# Altium schematic sheet RK3588-DDR-Controller.SchDoc
size 420 x 297 mm; SheetNumber: 6; SheetTotal: 22
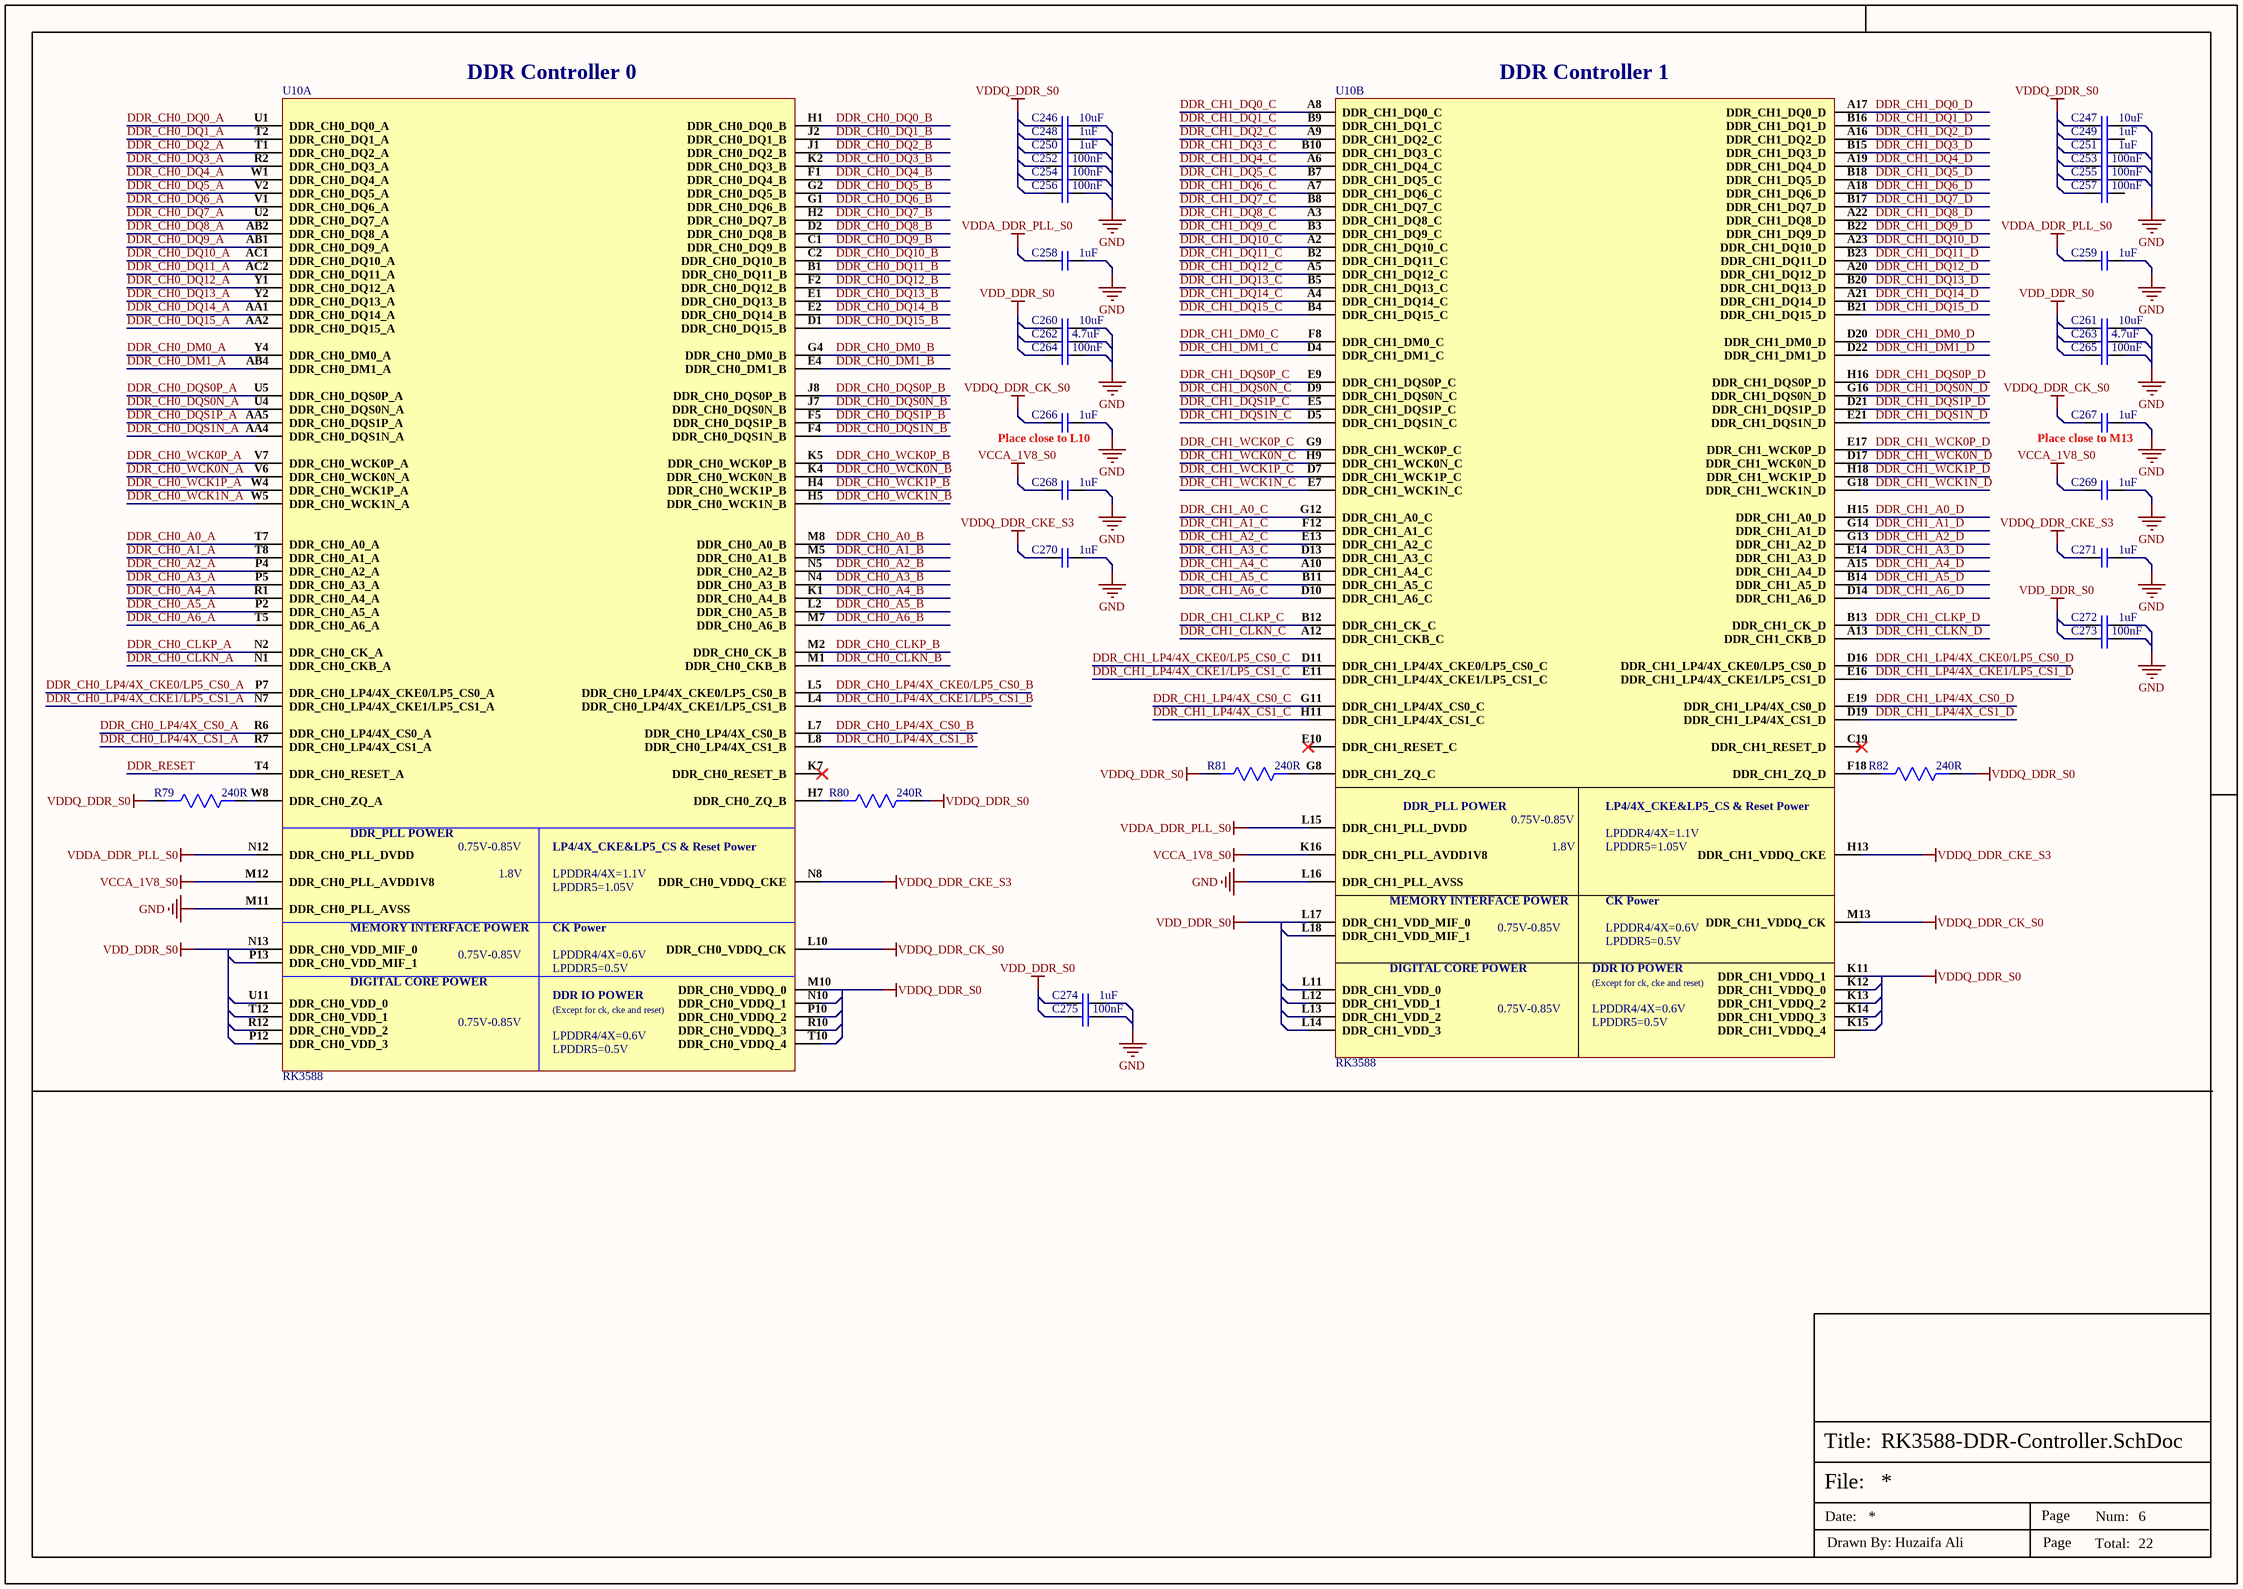
[diagram p0: RK3588-DDR-Controller.SchDoc]

## Parts
C246  10uF  [Cap-0402]
C247  10uF  [Cap-0402]
C248  1uF  [CAP-0201]
C249  1uF  [CAP-0201]
C250  1uF  [CAP-0201]
C251  1uF  [CAP-0201]
C252  100nF  [CAP-0201]
C253  100nF  [CAP-0201]
C254  100nF  [CAP-0201]
C255  100nF  [CAP-0201]
C256  100nF  [CAP-0201]
C257  100nF  [CAP-0201]
C258  1uF  [CAP-0201]
C259  1uF  [CAP-0201]
C260  10uF  [Cap-0402]
C261  10uF  [Cap-0402]
C262  4.7uF  [Cap-0402]
C263  4.7uF  [Cap-0402]
C264  100nF  [CAP-0201]
C265  100nF  [CAP-0201]
C266  1uF  [CAP-0201]
C267  1uF  [CAP-0201]
C268  1uF  [CAP-0201]
C269  1uF  [CAP-0201]
C270  1uF  [CAP-0201]
C271  1uF  [CAP-0201]
C272  1uF  [CAP-0201]
C273  100nF  [CAP-0201]
C274  1uF  [CAP-0201]
C275  100nF  [CAP-0201]
R79  240R  [Res-0402]
R80  240R  [Res-0402]
R81  240R  [Res-0402]
R82  240R  [Res-0402]
U10  RK3588  [FCBGA-1088L]  (parts A,B of 26)

## Nets
GND: C246.2 C247.2 C248.2 C250.2 C251.2 C252.2 C253.2 C254.2 C255.2 C256.2 C258.2 C259.2 C260.2 C261.2 C262.2 C263.2 C264.2 C265.2 C266.2 C267.2 C268.2 C269.2 C270.2 C271.2 C272.2 C273.2 C274.2 C275.2 U10.L16(DDR_CH1_PLL_AVSS) U10.M11(DDR_CH0_PLL_AVSS)
VCCA_1V8_S0: C268.1 C269.1 U10.K16(DDR_CH1_PLL_AVDD1V8) U10.M12(DDR_CH0_PLL_AVDD1V8)
VDD_DDR_S0: C260.1 C261.1 C262.1 C263.1 C264.1 C265.1 C272.1 C273.1 C274.1 C275.1 U10.L11(DDR_CH1_VDD_0) U10.L12(DDR_CH1_VDD_1) U10.L13(DDR_CH1_VDD_2) U10.L14(DDR_CH1_VDD_3) U10.L17(DDR_CH1_VDD_MIF_0) U10.L18(DDR_CH1_VDD_MIF_1) U10.N13(DDR_CH0_VDD_MIF_0) U10.P12(DDR_CH0_VDD_3) U10.P13(DDR_CH0_VDD_MIF_1) U10.R12(DDR_CH0_VDD_2) U10.T12(DDR_CH0_VDD_1) U10.U11(DDR_CH0_VDD_0)
VDDA_DDR_PLL_S0: C258.1 C259.1 U10.L15(DDR_CH1_PLL_DVDD) U10.N12(DDR_CH0_PLL_DVDD)
VDDQ_DDR_CK_S0: C266.1 C267.1 U10.L10(DDR_CH0_VDDQ_CK) U10.M13(DDR_CH1_VDDQ_CK)
VDDQ_DDR_CKE_S3: C270.1 C271.1 U10.H13(DDR_CH1_VDDQ_CKE) U10.N8(DDR_CH0_VDDQ_CKE)
VDDQ_DDR_S0: C246.1 C247.1 C248.1 C249.1 C250.1 C251.1 C252.1 C253.1 C254.1 C255.1 C256.1 C257.1 R79.2 R80.1 R81.2 R82.1 U10.K11(DDR_CH1_VDDQ_1) U10.K12(DDR_CH1_VDDQ_0) U10.K13(DDR_CH1_VDDQ_2) U10.K14(DDR_CH1_VDDQ_3) U10.K15(DDR_CH1_VDDQ_4) U10.M10(DDR_CH0_VDDQ_0) U10.N10(DDR_CH0_VDDQ_1) U10.P10(DDR_CH0_VDDQ_2) U10.R10(DDR_CH0_VDDQ_3) U10.T10(DDR_CH0_VDDQ_4)
DDR_CH0_A0_A: U10.T7(DDR_CH0_A0_A)
DDR_CH0_A0_B: U10.M8(DDR_CH0_A0_B)
DDR_CH0_A1_A: U10.T8(DDR_CH0_A1_A)
DDR_CH0_A1_B: U10.M5(DDR_CH0_A1_B)
DDR_CH0_A2_A: U10.P4(DDR_CH0_A2_A)
DDR_CH0_A2_B: U10.N5(DDR_CH0_A2_B)
DDR_CH0_A3_A: U10.P5(DDR_CH0_A3_A)
DDR_CH0_A3_B: U10.N4(DDR_CH0_A3_B)
DDR_CH0_A4_A: U10.R1(DDR_CH0_A4_A)
DDR_CH0_A4_B: U10.K1(DDR_CH0_A4_B)
DDR_CH0_A5_A: U10.P2(DDR_CH0_A5_A)
DDR_CH0_A5_B: U10.L2(DDR_CH0_A5_B)
DDR_CH0_A6_A: U10.T5(DDR_CH0_A6_A)
DDR_CH0_A6_B: U10.M7(DDR_CH0_A6_B)
DDR_CH0_CLKN_A: U10.N1(DDR_CH0_CKB_A)
DDR_CH0_CLKN_B: U10.M1(DDR_CH0_CKB_B)
DDR_CH0_CLKP_A: U10.N2(DDR_CH0_CK_A)
DDR_CH0_CLKP_B: U10.M2(DDR_CH0_CK_B)
DDR_CH0_DM0_A: U10.Y4(DDR_CH0_DM0_A)
DDR_CH0_DM0_B: U10.G4(DDR_CH0_DM0_B)
DDR_CH0_DM1_A: U10.AB4(DDR_CH0_DM1_A)
DDR_CH0_DM1_B: U10.E4(DDR_CH0_DM1_B)
DDR_CH0_DQ0_A: U10.U1(DDR_CH0_DQ0_A)
DDR_CH0_DQ0_B: U10.H1(DDR_CH0_DQ0_B)
DDR_CH0_DQ1_A: U10.T2(DDR_CH0_DQ1_A)
DDR_CH0_DQ1_B: U10.J2(DDR_CH0_DQ1_B)
DDR_CH0_DQ2_A: U10.T1(DDR_CH0_DQ2_A)
DDR_CH0_DQ2_B: U10.J1(DDR_CH0_DQ2_B)
DDR_CH0_DQ3_A: U10.R2(DDR_CH0_DQ3_A)
DDR_CH0_DQ3_B: U10.K2(DDR_CH0_DQ3_B)
DDR_CH0_DQ4_A: U10.W1(DDR_CH0_DQ4_A)
DDR_CH0_DQ4_B: U10.F1(DDR_CH0_DQ4_B)
DDR_CH0_DQ5_A: U10.V2(DDR_CH0_DQ5_A)
DDR_CH0_DQ5_B: U10.G2(DDR_CH0_DQ5_B)
DDR_CH0_DQ6_A: U10.V1(DDR_CH0_DQ6_A)
DDR_CH0_DQ6_B: U10.G1(DDR_CH0_DQ6_B)
DDR_CH0_DQ7_A: U10.U2(DDR_CH0_DQ7_A)
DDR_CH0_DQ7_B: U10.H2(DDR_CH0_DQ7_B)
DDR_CH0_DQ8_A: U10.AB2(DDR_CH0_DQ8_A)
DDR_CH0_DQ8_B: U10.D2(DDR_CH0_DQ8_B)
DDR_CH0_DQ9_A: U10.AB1(DDR_CH0_DQ9_A)
DDR_CH0_DQ9_B: U10.C1(DDR_CH0_DQ9_B)
DDR_CH0_DQ10_A: U10.AC1(DDR_CH0_DQ10_A)
DDR_CH0_DQ10_B: U10.C2(DDR_CH0_DQ10_B)
DDR_CH0_DQ11_A: U10.AC2(DDR_CH0_DQ11_A)
DDR_CH0_DQ11_B: U10.B1(DDR_CH0_DQ11_B)
DDR_CH0_DQ12_A: U10.Y1(DDR_CH0_DQ12_A)
DDR_CH0_DQ12_B: U10.F2(DDR_CH0_DQ12_B)
DDR_CH0_DQ13_A: U10.Y2(DDR_CH0_DQ13_A)
DDR_CH0_DQ13_B: U10.E1(DDR_CH0_DQ13_B)
DDR_CH0_DQ14_A: U10.AA1(DDR_CH0_DQ14_A)
DDR_CH0_DQ14_B: U10.E2(DDR_CH0_DQ14_B)
DDR_CH0_DQ15_A: U10.AA2(DDR_CH0_DQ15_A)
DDR_CH0_DQ15_B: U10.D1(DDR_CH0_DQ15_B)
DDR_CH0_DQS0N_A: U10.U4(DDR_CH0_DQS0N_A)
DDR_CH0_DQS0N_B: U10.J7(DDR_CH0_DQS0N_B)
DDR_CH0_DQS0P_A: U10.U5(DDR_CH0_DQS0P_A)
DDR_CH0_DQS0P_B: U10.J8(DDR_CH0_DQS0P_B)
DDR_CH0_DQS1N_A: U10.AA4(DDR_CH0_DQS1N_A)
DDR_CH0_DQS1N_B: U10.F4(DDR_CH0_DQS1N_B)
DDR_CH0_DQS1P_A: U10.AA5(DDR_CH0_DQS1P_A)
DDR_CH0_DQS1P_B: U10.F5(DDR_CH0_DQS1P_B)
DDR_CH0_LP4/4X_CKE0/LP5_CS0_A: U10.P7(DDR_CH0_LP4/4X_CKE0/LP5_CS0_A)
DDR_CH0_LP4/4X_CKE0/LP5_CS0_B: U10.L5(DDR_CH0_LP4/4X_CKE0/LP5_CS0_B)
DDR_CH0_LP4/4X_CKE1/LP5_CS1_A: U10.N7(DDR_CH0_LP4/4X_CKE1/LP5_CS1_A)
DDR_CH0_LP4/4X_CKE1/LP5_CS1_B: U10.L4(DDR_CH0_LP4/4X_CKE1/LP5_CS1_B)
DDR_CH0_LP4/4X_CS0_A: U10.R6(DDR_CH0_LP4/4X_CS0_A)
DDR_CH0_LP4/4X_CS0_B: U10.L7(DDR_CH0_LP4/4X_CS0_B)
DDR_CH0_LP4/4X_CS1_A: U10.R7(DDR_CH0_LP4/4X_CS1_A)
DDR_CH0_LP4/4X_CS1_B: U10.L8(DDR_CH0_LP4/4X_CS1_B)
DDR_CH0_WCK0N_A: U10.V6(DDR_CH0_WCK0N_A)
DDR_CH0_WCK0N_B: U10.K4(DDR_CH0_WCK0N_B)
DDR_CH0_WCK0P_A: U10.V7(DDR_CH0_WCK0P_A)
DDR_CH0_WCK0P_B: U10.K5(DDR_CH0_WCK0P_B)
DDR_CH0_WCK1N_A: U10.W5(DDR_CH0_WCK1N_A)
DDR_CH0_WCK1N_B: U10.H5(DDR_CH0_WCK1N_B)
DDR_CH0_WCK1P_A: U10.W4(DDR_CH0_WCK1P_A)
DDR_CH0_WCK1P_B: U10.H4(DDR_CH0_WCK1P_B)
DDR_CH1_A0_C: U10.G12(DDR_CH1_A0_C)
DDR_CH1_A0_D: U10.H15(DDR_CH1_A0_D)
DDR_CH1_A1_C: U10.F12(DDR_CH1_A1_C)
DDR_CH1_A1_D: U10.G14(DDR_CH1_A1_D)
DDR_CH1_A2_C: U10.E13(DDR_CH1_A2_C)
DDR_CH1_A2_D: U10.G13(DDR_CH1_A2_D)
DDR_CH1_A3_C: U10.D13(DDR_CH1_A3_C)
DDR_CH1_A3_D: U10.E14(DDR_CH1_A3_D)
DDR_CH1_A4_C: U10.A10(DDR_CH1_A4_C)
DDR_CH1_A4_D: U10.A15(DDR_CH1_A4_D)
DDR_CH1_A5_C: U10.B11(DDR_CH1_A5_C)
DDR_CH1_A5_D: U10.B14(DDR_CH1_A5_D)
DDR_CH1_A6_C: U10.D10(DDR_CH1_A6_C)
DDR_CH1_A6_D: U10.D14(DDR_CH1_A6_D)
DDR_CH1_CLKN_C: U10.A12(DDR_CH1_CKB_C)
DDR_CH1_CLKN_D: U10.A13(DDR_CH1_CKB_D)
DDR_CH1_CLKP_C: U10.B12(DDR_CH1_CK_C)
DDR_CH1_CLKP_D: U10.B13(DDR_CH1_CK_D)
DDR_CH1_DM0_C: U10.F8(DDR_CH1_DM0_C)
DDR_CH1_DM0_D: U10.D20(DDR_CH1_DM0_D)
DDR_CH1_DM1_C: U10.D4(DDR_CH1_DM1_C)
DDR_CH1_DM1_D: U10.D22(DDR_CH1_DM1_D)
DDR_CH1_DQ0_C: U10.A8(DDR_CH1_DQ0_C)
DDR_CH1_DQ0_D: U10.A17(DDR_CH1_DQ0_D)
DDR_CH1_DQ1_C: U10.B9(DDR_CH1_DQ1_C)
DDR_CH1_DQ1_D: U10.B16(DDR_CH1_DQ1_D)
DDR_CH1_DQ2_C: U10.A9(DDR_CH1_DQ2_C)
DDR_CH1_DQ2_D: U10.A16(DDR_CH1_DQ2_D)
DDR_CH1_DQ3_C: U10.B10(DDR_CH1_DQ3_C)
DDR_CH1_DQ3_D: U10.B15(DDR_CH1_DQ3_D)
DDR_CH1_DQ4_C: U10.A6(DDR_CH1_DQ4_C)
DDR_CH1_DQ4_D: U10.A19(DDR_CH1_DQ4_D)
DDR_CH1_DQ5_C: U10.B7(DDR_CH1_DQ5_C)
DDR_CH1_DQ5_D: U10.B18(DDR_CH1_DQ5_D)
DDR_CH1_DQ6_C: U10.A7(DDR_CH1_DQ6_C)
DDR_CH1_DQ6_D: U10.A18(DDR_CH1_DQ6_D)
DDR_CH1_DQ7_C: U10.B8(DDR_CH1_DQ7_C)
DDR_CH1_DQ7_D: U10.B17(DDR_CH1_DQ7_D)
DDR_CH1_DQ8_C: U10.A3(DDR_CH1_DQ8_C)
DDR_CH1_DQ8_D: U10.A22(DDR_CH1_DQ8_D)
DDR_CH1_DQ9_C: U10.B3(DDR_CH1_DQ9_C)
DDR_CH1_DQ9_D: U10.B22(DDR_CH1_DQ9_D)
DDR_CH1_DQ10_C: U10.A2(DDR_CH1_DQ10_C)
DDR_CH1_DQ10_D: U10.A23(DDR_CH1_DQ10_D)
DDR_CH1_DQ11_C: U10.B2(DDR_CH1_DQ11_C)
DDR_CH1_DQ11_D: U10.B23(DDR_CH1_DQ11_D)
DDR_CH1_DQ12_C: U10.A5(DDR_CH1_DQ12_C)
DDR_CH1_DQ12_D: U10.A20(DDR_CH1_DQ12_D)
DDR_CH1_DQ13_C: U10.B5(DDR_CH1_DQ13_C)
DDR_CH1_DQ13_D: U10.B20(DDR_CH1_DQ13_D)
DDR_CH1_DQ14_C: U10.A4(DDR_CH1_DQ14_C)
DDR_CH1_DQ14_D: U10.A21(DDR_CH1_DQ14_D)
DDR_CH1_DQ15_C: U10.B4(DDR_CH1_DQ15_C)
DDR_CH1_DQ15_D: U10.B21(DDR_CH1_DQ15_D)
DDR_CH1_DQS0N_C: U10.D9(DDR_CH1_DQS0N_C)
DDR_CH1_DQS0N_D: U10.G16(DDR_CH1_DQS0N_D)
DDR_CH1_DQS0P_C: U10.E9(DDR_CH1_DQS0P_C)
DDR_CH1_DQS0P_D: U10.H16(DDR_CH1_DQS0P_D)
DDR_CH1_DQS1N_C: U10.D5(DDR_CH1_DQS1N_C)
DDR_CH1_DQS1N_D: U10.E21(DDR_CH1_DQS1N_D)
DDR_CH1_DQS1P_C: U10.E5(DDR_CH1_DQS1P_C)
DDR_CH1_DQS1P_D: U10.D21(DDR_CH1_DQS1P_D)
DDR_CH1_LP4/4X_CKE0/LP5_CS0_C: U10.D11(DDR_CH1_LP4/4X_CKE0/LP5_CS0_C)
DDR_CH1_LP4/4X_CKE0/LP5_CS0_D: U10.D16(DDR_CH1_LP4/4X_CKE0/LP5_CS0_D)
DDR_CH1_LP4/4X_CKE1/LP5_CS1_C: U10.E11(DDR_CH1_LP4/4X_CKE1/LP5_CS1_C)
DDR_CH1_LP4/4X_CKE1/LP5_CS1_D: U10.E16(DDR_CH1_LP4/4X_CKE1/LP5_CS1_D)
DDR_CH1_LP4/4X_CS0_C: U10.G11(DDR_CH1_LP4/4X_CS0_C)
DDR_CH1_LP4/4X_CS0_D: U10.E19(DDR_CH1_LP4/4X_CS0_D)
DDR_CH1_LP4/4X_CS1_C: U10.H11(DDR_CH1_LP4/4X_CS1_C)
DDR_CH1_LP4/4X_CS1_D: U10.D19(DDR_CH1_LP4/4X_CS1_D)
DDR_CH1_WCK0N_C: U10.H9(DDR_CH1_WCK0N_C)
DDR_CH1_WCK0N_D: U10.D17(DDR_CH1_WCK0N_D)
DDR_CH1_WCK0P_C: U10.G9(DDR_CH1_WCK0P_C)
DDR_CH1_WCK0P_D: U10.E17(DDR_CH1_WCK0P_D)
DDR_CH1_WCK1N_C: U10.E7(DDR_CH1_WCK1N_C)
DDR_CH1_WCK1N_D: U10.G18(DDR_CH1_WCK1N_D)
DDR_CH1_WCK1P_C: U10.D7(DDR_CH1_WCK1P_C)
DDR_CH1_WCK1P_D: U10.H18(DDR_CH1_WCK1P_D)
DDR_RESET: U10.T4(DDR_CH0_RESET_A)
NetR79_1: R79.1 U10.W8(DDR_CH0_ZQ_A)
NetR80_2: R80.2 U10.H7(DDR_CH0_ZQ_B)
NetR81_1: R81.1 U10.G8(DDR_CH1_ZQ_C)
NetR82_2: R82.2 U10.F18(DDR_CH1_ZQ_D)

Not connected (* = marked no-connect by the designer): C249 2; C257 2; U10 C19(DDR_CH1_RESET_D)* E10(DDR_CH1_RESET_C)* K7(DDR_CH0_RESET_B)*

## Notes on the sheet
- (near U10) DDR Controller 0
- (near U10) DDR Controller 1
- (near C266) Place close to L10
- (near C267) Place close to M13
- File:
- Title:
- Date:
- Page
- Num:
- Total:
- Drawn By: Huzaifa Ali
- (in symbol RK3588, part A) DDR_PLL POWER; 0.75V-0.85V; LP4/4X_CKE&LP5_CS & Reset Power; 1.8V; LPDDR4/4X=1.1V; LPDDR5=1.05V; MEMORY INTERFACE POWER; CK Power; LPDDR4/4X=0.6V; LPDDR5=0.5V; DIGITAL CORE POWER; DDR IO POWER; (Except for ck, cke and reset)
- (in symbol RK3588, part B) DDR_PLL POWER; LP4/4X_CKE&LP5_CS & Reset Power; 0.75V-0.85V; LPDDR4/4X=1.1V; 1.8V; LPDDR5=1.05V; MEMORY INTERFACE POWER; CK Power; LPDDR4/4X=0.6V; LPDDR5=0.5V; DIGITAL CORE POWER; DDR IO POWER; (Except for ck, cke and reset)

## Library data of the parts
C246 C247 C260 C261 = AMK105CBJ106MV-F: CAP CER 10UF 4V X5R 0402; Manufacturer: Taiyo Yuden; Tolerance: 20%; Item Type: Capacitor; Supplier 1: Mouser; Manufacturer Part Number: AMK105CBJ106MV-F; RoHS: Yes; Category: Ceramic Capacitors; Stock 1: 507215; Pricing 1: 1=0.23000, 10=0.10300, 50=0.10300, 100=0.07800, 1000=0.04700, 10000=0.03900 (USD); Mount: Surface Mount; Case/Package: 0402; Case Code (Imperial): 0402; Case Code (Metric): 1005; Min Operating Temperature: -55°C; Max Operating Temperature: 85°C; Capacitance: 10uF; Dielectric: X5R; Package Quantity: 1; Packaging: Tape and Reel; Termination: SMD/SMT; Voltage Rating (DC): 4V; Voltage Rating: 4V; Series: M; Construction: Flat; Length: 0.039inch; Width: 0.02inch; Height: 0.5mm; Thickness: 0.028inch; RoHS Compliant: Yes; REACH SVHC: Unknown; Halogen Free: Halogen Free; ComponentLink1URL: https://datasheet.ciiva.com/6255/amk105cbj106mv-f-ss-6255363.pdf?src-supplier=Digi-Key; ComponentLink1Description: https://datasheet.ciiva.com/6255/amk105cbj106mv-f-ss-6255363.pdf?src-supplier=Digi-Key; ComponentLink2URL: https://datasheet.ciiva.com/30133/411amk105cbj106mv-f-30133635.pdf?src-supplier=Onlinecomponents.com; ComponentLink2Description: https://datasheet.ciiva.com/30133/411amk105cbj106mv-f-30133635.pdf?src-supplier=Onlinecomponents.com; ComponentLink3URL: https://datasheet.ciiva.com/15916/2amk105cbj106mv-f-15916827.pdf?src-supplier=Onlinecomponents.com; ComponentLink3Description: https://datasheet.ciiva.com/15916/2amk105cbj106mv-f-15916827.pdf?src-supplier=Onlinecomponents.com; Supplier Part Number 1: 963-AMK105CBJ106MV-F; LCSC Part Number: C454073
C248-C251 C258 C259 C266-C272 C274 = CC0201KRX5R5BB105: CAP CER 1UF 6.3V X5R 0201; Manufacturer: Yageo; Tolerance: 10%; Supplier 1: Digi-Key; Manufacturer Part Number: CC0201KRX5R5BB105; RoHS: Yes; Category: Ceramic Capacitors; Stock 1: 1909543; Pricing 1: 1=0.10000, 10=0.04600, 50=0.02500, 100=0.02050, 500=0.01464, 1000=0.01150, 2500=0.01045, 5000=0.00962 (USD); Mount: Surface Mount; Case/Package: 0201; Case Code (Imperial): 0201; Case Code (Metric): 0603; Min Operating Temperature: -55°C; Max Operating Temperature: 85°C; Packaging: Cut Tape; Capacitance: 1uF; Voltage Rating: 6.3V; RoHS Compliant: Yes; ComponentLink1URL: http://www.yageo.com/documents/recent/UPY-GPHC_X5R_4V-to-50V_25.pdf?src-supplier=Digi-Key; ComponentLink1Description: http://www.yageo.com/documents/recent/UPY-GPHC_X5R_4V-to-50V_25.pdf?src-supplier=Digi-Key; ComponentLink2URL: https://www.yageo.com/upload/media/product/productsearch/datasheet/mlcc/UPY-GPHC_X5R_4V-to-50V_26.pdf?src-supplier=Digi-Key; ComponentLink2Description: https://www.yageo.com/upload/media/product/productsearch/datasheet/mlcc/UPY-GPHC_X5R_4V-to-50V_26.pdf?src-supplier=Digi-Key; Supplier Part Number 1: 311-3471-1-ND
C252-C257 C264 C265 C273 C275 = CC0201KRX5R6BB104: CAP CER 0.1UF 10V X5R 0201; Manufacturer: Yageo; Tolerance: 10%; Supplier 1: Mouser; Manufacturer Part Number: CC0201KRX5R6BB104; RoHS: Yes; Category: Ceramic Capacitors; Stock 1: 824403; Pricing 1: 1=0.10000, 10=0.02400, 50=0.02400, 100=0.01900, 1000=0.01100, 10000=0.00900 (USD); Mount: Surface Mount; Case/Package: 0201; Case Code (Imperial): 0201; Case Code (Metric): 0603; Weight: 6E-06oz; Min Operating Temperature: -55°C; Max Operating Temperature: 85°C; Capacitance: 100nF; Dielectric: X5R; Voltage Rating (DC): 10V; Packaging: Tape and Reel; Termination: SMD/SMT; Resistor Type: Ceramic; Voltage Rating: 10V; Series: CC; Construction: Flat; Length: 0.6mm; Width: 0.012inch; Height: 0.3mm; Thickness: 0.013inch; Depth: 0.3mm; Radiation Hardening: No; Lead Free: Lead Free; Halogen Free: Halogen Free; RoHS Compliant: Yes; ComponentLink1URL: https://datasheet.ciiva.com/11587/upy-gphc-x5r-4v-to-50v-12-11587190.pdf?src-supplier=Avnet; ComponentLink1Description: https://datasheet.ciiva.com/11587/upy-gphc-x5r-4v-to-50v-12-11587190.pdf?src-supplier=Avnet; Supplier Part Number 1: 603-CC201KRX5R6BB104; LCSC Part Number: C190183
C262 C263 = CC0402KRX5R5BB475: CAP CER 4.7UF 6.3V X5R 0402; Manufacturer: Yageo; Tolerance: 10%; Supplier 1: Digi-Key; Manufacturer Part Number: CC0402KRX5R5BB475; RoHS: Yes; Category: Ceramic Capacitors; Stock 1: 1127839; Pricing 1: 1=0.19000, 10=0.12700, 50=0.07600, 100=0.06420, 500=0.04396, 1000=0.03889, 2500=0.03720, 5000=0.03381 (USD); Case/Package: 0402; Voltage Rating (DC): 6.3V; Dielectric: X5R; Capacitance: 4.7uF; Lead Free: Lead Free; Halogen Free: Halogen Free; RoHS Compliant: Yes; ComponentLink1URL: http://www.yageo.com/documents/recent/UPY-GPHC_X5R_4V-to-50V_25.pdf?src-supplier=Digi-Key; ComponentLink1Description: http://www.yageo.com/documents/recent/UPY-GPHC_X5R_4V-to-50V_25.pdf?src-supplier=Digi-Key; ComponentLink2URL: https://www.yageo.com/upload/media/product/productsearch/datasheet/mlcc/UPY-GPHC_X5R_4V-to-50V_26.pdf?src-supplier=Digi-Key; ComponentLink2Description: https://www.yageo.com/upload/media/product/productsearch/datasheet/mlcc/UPY-GPHC_X5R_4V-to-50V_26.pdf?src-supplier=Digi-Key; Supplier Part Number 1: 311-3476-1-ND
R79-R82 = RC0402FR-07240RL: RES 240 OHM 1% 1/16W 0402; Manufacturer: Yageo; Power Rating: 63mW; Temperature Coefficient: 100ppm/°C; Voltage Rating (DC): 50V; Supplier 1: Mouser; Manufacturer Part Number: RC0402FR-07240RL; RoHS: Yes; Category: Chip SMD Resistors; Stock 1: 1903202; Pricing 1: 1=0.10000, 10=0.01200, 50=0.01200, 100=0.00500, 1000=0.00300, 10000=0.00100 (USD); Case/Package: 0402; Case Code (Metric): 1005; Case Code (Imperial): 0402; Size Code: 0402; Min Operating Temperature: -55°C; Max Operating Temperature: 155°C; Resistance: 240R; Tolerance: 1%; Packaging: Tape and Reel; Resistor Type: Thick Film; Voltage Rating: 50V; Package Quantity: 1; Number of Terminations: 2; Termination: SMD/SMT; Max Power Dissipation: 63mW; Features: Moisture Resistant; Series: RC; Construction: Rectangular; Resistance Tolerance: 1%; Length: 1mm; Width: 0.02inch; Height: 0.016inch; Depth: 0.5mm; REACH SVHC: Unknown; Lead Free: Lead Free; RoHS Compliant: Yes; Military Standard: Not; ComponentLink1URL: https://datasheet.ciiva.com/7849/1018594-7849915.pdf?src-supplier=Element14; ComponentLink1Description: https://datasheet.ciiva.com/7849/1018594-7849915.pdf?src-supplier=Element14; ComponentLink2URL: https://datasheet.ciiva.com/7849/1018594-7849916.pdf?src-supplier=Element14; ComponentLink2Description: https://datasheet.ciiva.com/7849/1018594-7849916.pdf?src-supplier=Element14; ComponentLink3URL: https://datasheet.ciiva.com/2519/pyu-r-int-thick-7-2519157.pdf?src-supplier=Digi-Key; ComponentLink3Description: https://datasheet.ciiva.com/2519/pyu-r-int-thick-7-2519157.pdf?src-supplier=Digi-Key; ComponentLink4URL: https://datasheet.ciiva.com/2519/pyu-r-int-thick-7-2519158.pdf?src-supplier=Digi-Key; ComponentLink4Description: https://datasheet.ciiva.com/2519/pyu-r-int-thick-7-2519158.pdf?src-supplier=Digi-Key; ComponentLink5URL: https://datasheet.ciiva.com/2519/pyu-r-int-thick-7-2519156.pdf?src-supplier=Digi-Key; ComponentLink5Description: https://datasheet.ciiva.com/2519/pyu-r-int-thick-7-2519156.pdf?src-supplier=Digi-Key; ComponentLink6URL: https://datasheet.ciiva.com/12669/pyu-rc0402-51-rohs-l-6-r-12669689.pdf?src-supplier=Mouser; ComponentLink6Description: https://datasheet.ciiva.com/12669/pyu-rc0402-51-rohs-l-6-r-12669689.pdf?src-supplier=Mouser; ComponentLink7URL: https://datasheet.ciiva.com/17419/pyu-rc0402-51-rohs-l-6-r-17419482.pdf?src-supplier=Future+Electronics; ComponentLink7Description: https://datasheet.ciiva.com/17419/pyu-rc0402-51-rohs-l-6-r-17419482.pdf?src-supplier=Future+Electronics; Supplier Part Number 1: 603-RC0402FR-07240RL
U10 = RK3588: Power Management IC; Manufacturer Part Number: RK3588LP4XEVB; Manufacturer: Rockchip; LCSC Part Number: *; Item Type: IC